# Altium schematic sheet Hdr3.SchDoc
size Letter; SheetNumber: 10; SheetTotal: 15
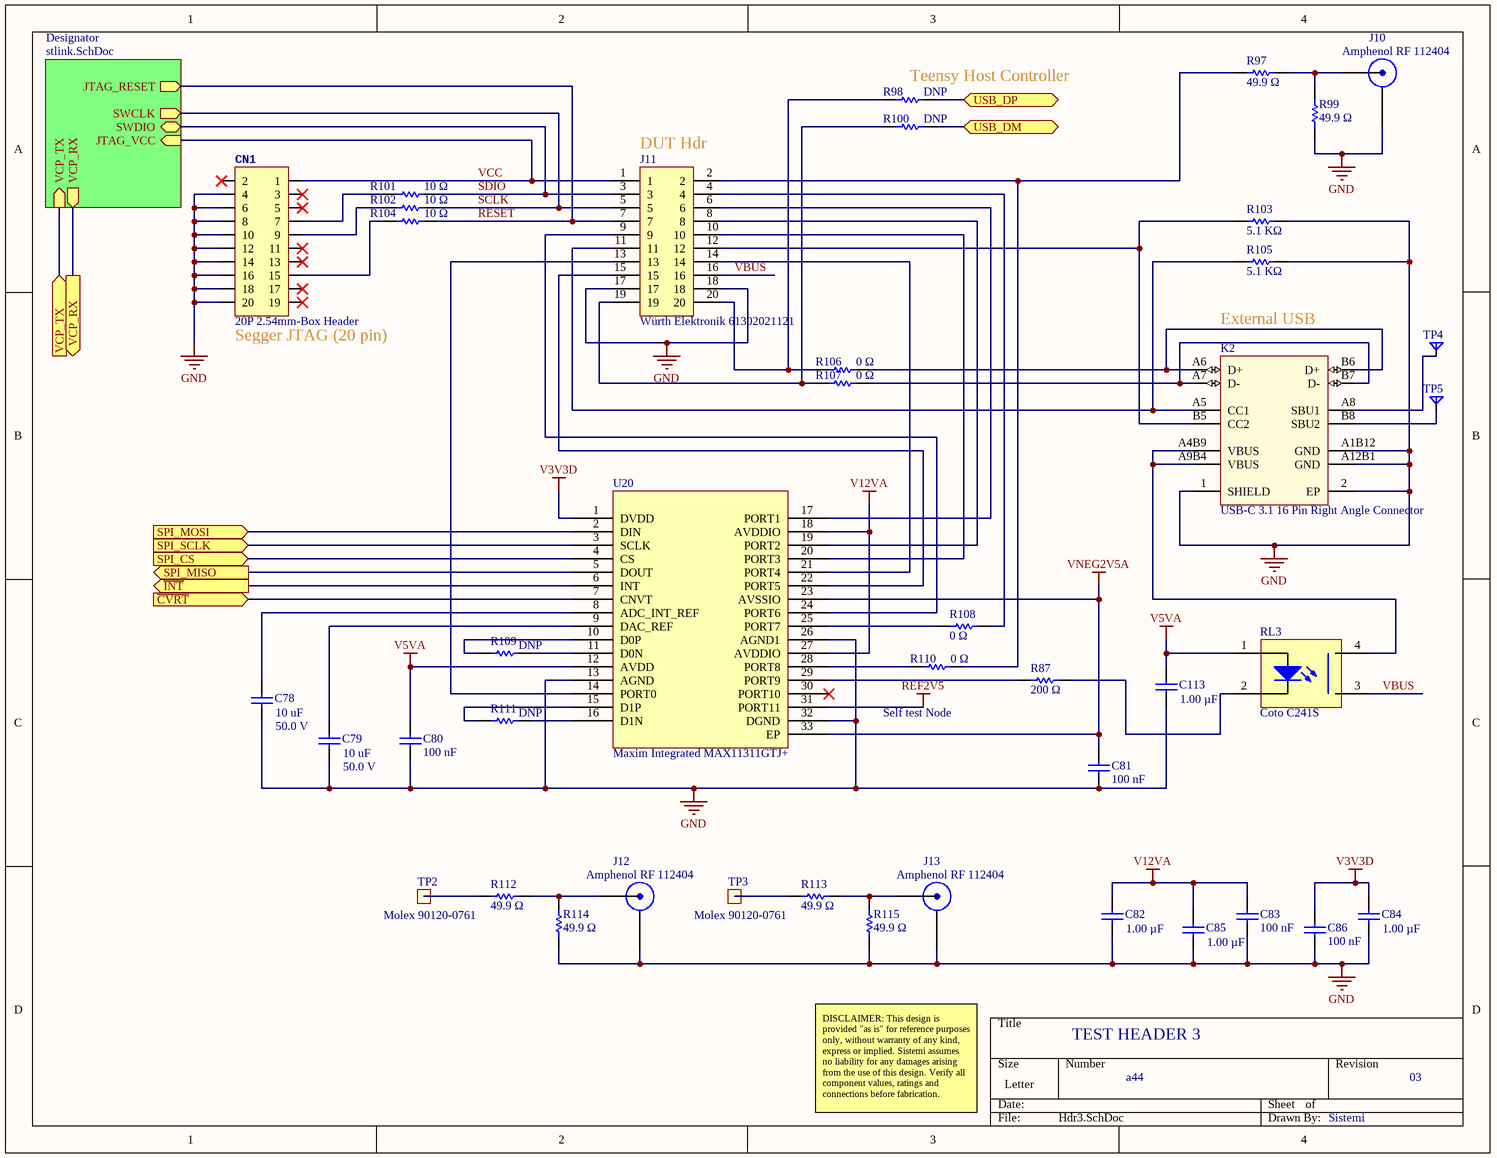
[diagram p0: Hdr3.SchDoc]

## Parts
C78  Capacitance: 10 uF  Voltage Rating (DC): 50.0 V  [CAPC3216X180X55LL20T25]  (hidden comment: Murata GRM31CR61H106KA12L)
C79  Capacitance: 10 uF  Voltage Rating (DC): 50.0 V  [CAPC3216X180X55LL20T25]  (hidden comment: Murata GRM31CR61H106KA12L)
C80  Capacitance: 100 nF  [CAPC1005X56X25NL10T15]  (hidden comment: Samsung CL05B104KO5NNNC)
C81  Capacitance: 100 nF  [CAPC1005X56X25NL10T15]  (hidden comment: Samsung CL05B104KO5NNNC)
C82  Capacitance: 1.00 µF  [CAPC1608X90X35NL15T15]  (hidden comment: Samsung CL10B105KA8NNNC)
C83  Capacitance: 100 nF  [CAPC1005X56X25NL10T15]  (hidden comment: Samsung CL05B104KO5NNNC)
C84  Capacitance: 1.00 µF  [CAPC1608X90X35NL15T15]  (hidden comment: Samsung CL10B105KA8NNNC)
C85  Capacitance: 1.00 µF  [CAPC1608X90X35NL15T15]  (hidden comment: Samsung CL10B105KA8NNNC)
C86  Capacitance: 100 nF  [CAPC1005X56X25NL10T15]  (hidden comment: Samsung CL05B104KO5NNNC)
C113  Capacitance: 1.00 µF  [CAPC1608X90X35NL15T15]  (hidden comment: Samsung CL10B105KA8NNNC)
CN1  20P 2.54mm-Box Header  [PCB-h3ow9p0wpqltbs651onh-1]
J10  Amphenol RF 112404  [PCB-bfdufqe5asedaz2dexug-1]
J11  Würth Elektronik 61302021121  [PCB-nk6cd1c3p7lqby8wsdwb-1]
J12  Amphenol RF 112404  [PCB-bfdufqe5asedaz2dexug-1]
J13  Amphenol RF 112404  [PCB-bfdufqe5asedaz2dexug-1]
K2  USB-C 3.1 16 Pin Right Angle Connector  [PCB-ld6ppm2v3fcnldhcn63r-1]
R87  Resistance: 200 Ω  [RESC1608X55X30LL15T15]  (hidden comment: Generic RES 0603)
R97  Resistance: 49.9 Ω  [RESC1608X55X30ML15T15]  (hidden comment: Generic RES 0603)
R98  Resistance: DNP  [RESC1608X55X30ML15T15]  (hidden comment: Generic RES 0603)
R99  Resistance: 49.9 Ω  [RESC1608X55X30ML15T15]  (hidden comment: Generic RES 0603)
R100  Resistance: DNP  [RESC1608X55X30ML15T15]  (hidden comment: Generic RES 0603)
R101  Resistance: 10 Ω  [RESC1005X40X25NL05T05]  (hidden comment: 10 Ω,±1%,0402)
R102  Resistance: 10 Ω  [RESC1005X40X25NL05T05]  (hidden comment: 10 Ω,±1%,0402)
R103  Resistance: 5.1 KΩ  [RESC1608X55X30ML15T15]  (hidden comment: Generic RES 0603)
R104  Resistance: 10 Ω  [RESC1005X40X25NL05T05]  (hidden comment: 10 Ω,±1%,0402)
R105  Resistance: 5.1 KΩ  [RESC1608X55X30ML15T15]  (hidden comment: Generic RES 0603)
R106  Resistance: 0 Ω  [RESC1608X55X30ML15T15]  (hidden comment: Generic RES 0603)
R107  Resistance: 0 Ω  [RESC1608X55X30ML15T15]  (hidden comment: Generic RES 0603)
R108  Resistance: 0 Ω  [RESC1608X55X30ML15T15]  (hidden comment: Generic RES 0603)
R109  Resistance: DNP  [RESC1608X55X30ML15T15]  (hidden comment: Generic RES 0603)
R110  Resistance: 0 Ω  [RESC1608X55X30ML15T15]  (hidden comment: Generic RES 0603)
R111  Resistance: DNP  [RESC1608X55X30ML15T15]  (hidden comment: Generic RES 0603)
R112  Resistance: 49.9 Ω  [RESC1608X55X30ML15T15]  (hidden comment: Generic RES 0603)
R113  Resistance: 49.9 Ω  [RESC1608X55X30ML15T15]  (hidden comment: Generic RES 0603)
R114  Resistance: 49.9 Ω  [RESC1608X55X30ML15T15]  (hidden comment: Generic RES 0603)
R115  Resistance: 49.9 Ω  [RESC1608X55X30ML15T15]  (hidden comment: Generic RES 0603)
RL3  Coto C241S  [PCB-o1m8470la7x8r6xoffbd-1]
TP2  Molex 90120-0761  [PCB-u1j2a009byds4mriae4x-1]
TP3  Molex 90120-0761  [PCB-u1j2a009byds4mriae4x-1]
TP4  Test Point Pad  [PCB-w5299rxaittb4m04ntfs-1]  (value not drawn)
TP5  Test Point Pad  [PCB-w5299rxaittb4m04ntfs-1]  (value not drawn)
U20  Maxim Integrated MAX11311GTJ+  [PCB-s1hzzxkmij8s4b201del-1]

## Sub-sheets
Designator = stlink.SchDoc: SWCLK (out), JTAG_RESET (out), SWDIO (bidir), JTAG_VCC (in), VCP_TX (in), VCP_RX (out)

## Ports
SPI_CS (in), SPI_MISO (out), SPI_MOSI (in), SPI_SCLK (in), USB_DM (bidir), USB_DP (bidir), VCP_RX (out), VCP_TX (in), ~{CVRT} (in), ~{INT} (out)

## Nets
GND: C78.1 C79.1 C80.2 C81.2 C82.1 C83.2 C84.1 C85.1 C86.2 C113.1 CN1.4 CN1.6 CN1.8 CN1.10 CN1.12 CN1.14 CN1.16 CN1.18 CN1.20 J10.2 J11.17 J11.18 J12.2 J13.2 K2.1(SHIELD) K2.2(EP) K2.A1B12(GND) K2.A12B1(GND) R99.2 R103.1 R105.1 R114.2 R115.2 U20.13(AGND) U20.26(AGND1) U20.32(DGND)
REF2V5: U20.31(PORT11)
V3V3D: C84.2 C86.1 U20.1(DVDD)
V5VA: C80.1 C113.2 RL3.1(A) U20.12(AVDD)
V12VA: C82.2 C83.1 C85.2 U20.18(AVDDIO) U20.27(AVDDIO)
VNEG2V5A: C81.1 U20.23(AVSSIO) U20.33(EP)
~{CVRT}: U20.7(CNVT) ; port ~{CVRT}
~{INT}: U20.6(INT) ; port ~{INT}
RESET: J11.7 R104.1 ; sheet Designator/JTAG_RESET
SCLK: J11.5 R102.1 ; sheet Designator/SWCLK
SDIO: J11.3 R101.1 ; sheet Designator/SWDIO
SPI_CS: U20.4(CS) ; port SPI_CS
SPI_MISO: U20.5(DOUT) ; port SPI_MISO
SPI_MOSI: U20.2(DIN) ; port SPI_MOSI
SPI_SCLK: U20.3(SCLK) ; port SPI_SCLK
USB_DM: R100.1 ; port USB_DM
USB_DP: R98.1 ; port USB_DP
VBUS: J11.16 RL3.3(S)
VCC: CN1.1 J11.1 ; sheet Designator/JTAG_VCC
VCP_RX: port VCP_RX, sheet Designator/VCP_RX
VCP_TX: port VCP_TX, sheet Designator/VCP_TX
NetC78_2: C78.2 U20.8(ADC_INT_REF)
NetC79_2: C79.2 U20.9(DAC_REF)
NetCN1_7: CN1.7 R101.2
NetCN1_9: CN1.9 R102.2
NetCN1_15: CN1.15 R104.2
NetJ10_1: J10.1 R97.2 R99.1
NetJ11_2: J11.2 R97.1 R110.1
NetJ11_4: J11.4 R108.1
NetJ11_6: J11.6 U20.17(PORT1)
NetJ11_8: J11.8 U20.19(PORT2)
NetJ11_9: J11.9 U20.24(PORT6)
NetJ11_10: J11.10 U20.20(PORT3)
NetJ11_11: J11.11 K2.A5(CC1) R105.2
NetJ11_12: J11.12 K2.B5(CC2) R103.2
NetJ11_13: J11.13 U20.14(PORT0)
NetJ11_14: J11.14 U20.21(PORT4)
NetJ11_15: J11.15 U20.22(PORT5)
NetJ11_19: J11.19 R100.2 R107.2
NetJ11_20: J11.20 R98.2 R106.2
NetJ12_1: J12.1 R112.2 R114.1
NetJ13_1: J13.1 R113.2 R115.1
NetK2_A4B9: K2.A4B9(VBUS) K2.A9B4(VBUS) RL3.4(D)
NetK2_A6: K2.A6(D+) K2.B6(D+) R106.1
NetK2_A7: K2.A7(D-) K2.B7(D-) R107.1
NetK2_A8: K2.A8(SBU1) TP4.1(A)
NetK2_B8: K2.B8(SBU2) TP5.1(A)
NetR87_1: R87.1 RL3.2(K)
NetR87_2: R87.2 U20.29(PORT9)
NetR108_2: R108.2 U20.25(PORT7)
NetR109_1: R109.1 U20.11(D0N)
NetR109_2: R109.2 U20.10(D0P)
NetR110_2: R110.2 U20.28(PORT8)
NetR111_1: R111.1 U20.16(D1N)
NetR111_2: R111.2 U20.15(D1P)
NetR112_1: R112.1 TP2.1
NetR113_1: R113.1 TP3.1

Not connected (* = marked no-connect by the designer): CN1 2* 3* 5* 11* 13* 17* 19*; U20 30(PORT10)*

## Notes on the sheet
- (near R98) Teensy Host Controller
- (near J11) DUT Hdr
- (near CN1) Segger JTAG (20 pin)
- External USB
- (near R110) Self test Node
- TEST HEADER 3
- DISCLAIMER: This design is provided "as is" for reference purposes only, without warranty of any kind, express or implied. Sistemi assumes no liability for any damages arising from the use of this design. Verify all component values, ratings and connections before fabrication.
- a44
- 03
- Sistemi

## Library data of the parts
C78 C79 = CMP-3554908-2: Multilayer Ceramic Capacitors MLCC - SMD/SMT 1206 10uF 50volt X5R +/-10%; Manufacturer Part Number: CL31B106KBHNNNE; Capacitance Tolerance: ±10%; Case/Package (SI): 3216; Lead-Free Status: Lead Free; Dielectric Characteristic: X5R; Lifecycle Status: Active; Mounting Style: Surface Mount; Number of Pins: 2; Octopart Url: https://octopart.com/grm31cr61h106ka12l-murata-18903335; OctopartID: fd8535afa9c42242; Packaging: Cut Tape (CT); REACH SVHC Compliance: No SVHC; RoHS: Compliant; Size-Length: 0.0032 m; Size-Thickness: 0.0016 m; Size-Width: 0.0016 m
C80 C81 C83 C86 = CMP-bf2276a55d9a60e5-19: Ceramic capacitor SMD-0402 100nF /16V X7R# K +-10%, Samsung, RoHS; Dielectric Characteristic: X7R; Lead-Free Status: Lead Free; Voltage Rating (DC): 16.0 V; Capacitance Tolerance: ±10%; Mounting Style: Surface Mount; Case/Package: 0402; OctopartID: 0755ced2c795d892; Footprint: PCB-0002-00476-3; Octopart URL: https://octopart.com/cl05b104ko5nnnc-samsung-9299366; RoHS: Compliant; Manufacturer Part Number: CL05B104KO5NNNC
C82 C84 C85 C113 = CMP-7473528-5: CL Series 0603 1 uF 25 V ±10 % X7R Surface Mount Multilayer Ceramic Capacitor; Manufacturer Part Number: UMK107AB7105KA-T; Lead-Free Status: Lead Free; Capacitance Tolerance: ±10%; Voltage Rating (DC): 25.0 V; RoHS: Compliant; Mounting Style: Surface Mount; Footprint: PCB-0002-00062-3; Octopart URL: http://octopart.com/cl10b105ka8nnnc-samsung-19831597; Case/Package: 0603; OctopartID: ce7a065e703111bd; Dielectric Characteristic: X7R
CN1 = CMP-2336eab41549fcf1-2: Male Box Header WR-BHD, THT, Vertical, pitch 2.54 mm, 20 pins; Manufacturer Part Number: 61202021621; Number of Contacts: 20; Dielectric Withstanding Voltage: 500 V; Current Rating: 3.00 A; Pin Pitch: 2.54 mm; Contact Resistance: 20.0 mΩ; Operating Voltage: 250 V; Insulation Resistance: 1.00 GΩ; Flammability Rating: UL 94 V-0; REACH SVHC Compliance: No SVHC; Color: Black; RoHS: Compliant; Mounting Style: Through Hole; Number of Pins: 20; Contact Plating: Gold; Packaging: Tray; OctopartID: 2336eab41549fcf1; Orientation: Vertical; Contact Material: Copper; Operating Temperature: -40.0 °C (min); Octopart URL: https://octopart.com/61202021621-w%C3%BCrth+elektronik-8917785; Gender: Male
J10 J12 J13 = CMP-eda0265619973267-4: connector, rf coaxial, bnc str pcb mt recept jack, 4 legs, length .717 inch, 50 ohm; Manufacturer Part Number: 112404; Lead-Free Status: Lead Free; Gender: Male; Frequency: 4.00 GHz (max); Dielectric Material: Teflon; OctopartID: eda0265619973267; ComponentLink1URL: https://grabcad.com/library/amphenol-rf-4-ghz-bnc-coaxial-bulkhead-vertical-pcb-connector-1; Contact Material: Phosphor Bronze; Mounting Style: Through Hole; Contact Plating: Gold; Octopart URL: https://octopart.com/112404-amphenol+rf-50123089; ComponentLink1Description: STEP model; RoHS: Compliant
J11 = CMP-005cc8a3733edf9b-7: THT Vertical Pin Header WR-PHD, Pitch 2.54 mm, Dual Row, 20 pins; Current Rating: 3.00 A; Dielectric Withstanding Voltage: 500 V; Pin Pitch: 2.54 mm; Operating Voltage: 250 V; Number of Contacts: 20; Contact Resistance: 20.0 mΩ; Gender: Male; Contact Material: Copper; Footprint: PCB-005cc8a3733edf9b-1; Mounting Style: Through Hole; Color: Black; Contact Plating: Gold; REACH SVHC Compliance: No SVHC; RoHS: Compliant; Octopart URL: https://octopart.com/61302021121-w%C3%BCrth+elektronik-32855556; Packaging: Bag; Orientation: Vertical; OctopartID: 005cc8a3733edf9b; Number of Pins: 20; Operating Temperature: -40.0 °C (min); Manufacturer Part Number: 61302021121
K2 = CMP-qyb7yekqcd84h33ugas0-5: Manufacturer Part Number: USB4105-GF-A-120; CustomComponentID: qyb7yekqcd84h33ugas0
R87 = CMP-0800c38b3cf2d7c7-3: Generic RES 0603, =Resistance+','+Tolerance+','+Case; Manufacturer Part Number: RT0603FRE10200RL; Case/Package (SI): 1608; Lead-Free Status: Lead Free; Power Rating: 63.0 mW; Voltage: 50V; ELV Compliant: Compliant; Tolerance: ±1%; Temperature Coefficient: -50.0 ppm/°C to 50.0 ppm/°C; Octopart URL: TBD; Number of Pins: 2; Mounting Style: Surface Mount; Packaging: Tape & Reel (TR); Lifecycle Status: Active; RoHS: Compliant; Case: 0603; Operating Temperature: -55.0 °C to 125 °C; REACH SVHC Compliance: No SVHC; Footprint: PCB-0002-00066-3; OctopartID: a8e96364fc37772e
R97 R99 R112-R115 = CMP-0800c38b3cf2d7c7-3: Generic RES 0603, =Resistance+','+Tolerance+','+Case; Manufacturer Part Number: AC1206FR-0749R9L; Case/Package (SI): 1608; Lead-Free Status: Lead Free; Power Rating: 63.0 mW; Voltage: 50V; ELV Compliant: Compliant; Tolerance: ±1%; Temperature Coefficient: -50.0 ppm/°C to 50.0 ppm/°C; Octopart URL: TBD; Number of Pins: 2; Mounting Style: Surface Mount; Packaging: Tape & Reel (TR); Lifecycle Status: Active; RoHS: Compliant; Case: 0603; Operating Temperature: -55.0 °C to 125 °C; REACH SVHC Compliance: No SVHC; Footprint: PCB-0002-00066-3; OctopartID: a8e96364fc37772e
R98 R100 R109 R111 = CMP-0800c38b3cf2d7c7-3: Generic RES 0603, =Resistance+','+Tolerance+','+Case; Manufacturer Part Number: TBD; Case/Package (SI): 1608; Lead-Free Status: Lead Free; Power Rating: 63.0 mW; Voltage: 50V; ELV Compliant: Compliant; Tolerance: ±1%; Temperature Coefficient: -50.0 ppm/°C to 50.0 ppm/°C; Octopart URL: TBD; Number of Pins: 2; Mounting Style: Surface Mount; Packaging: Tape & Reel (TR); Lifecycle Status: Active; RoHS: Compliant; Case: 0603; Operating Temperature: -55.0 °C to 125 °C; REACH SVHC Compliance: No SVHC; Footprint: PCB-0002-00066-3; OctopartID: a8e96364fc37772e
R101 R102 R104 = CMP-3902036-3: Generic RES 0402, =Resistance+','+Tolerance+','+Case; Manufacturer Part Number: RT0402FRE0710RL; Lead-Free Status: Lead Free; Voltage: 50.0 V; Power: 0.063 W; Mounting Style: Surface Mount; RoHS: Compliant; Number of Pins: 2; Tolerance: ±1%; Octopart Url: TBD; Case: 0402; OctopartID: 26dced8948c2f91b
R103 R105 = CMP-0800c38b3cf2d7c7-3: Generic RES 0603, =Resistance+','+Tolerance+','+Case; Manufacturer Part Number: RT0603FRE075K1L; Case/Package (SI): 1608; Lead-Free Status: Lead Free; Power Rating: 63.0 mW; Voltage: 50V; ELV Compliant: Compliant; Tolerance: ±1%; Temperature Coefficient: -50.0 ppm/°C to 50.0 ppm/°C; Octopart URL: TBD; Number of Pins: 2; Mounting Style: Surface Mount; Packaging: Tape & Reel (TR); Lifecycle Status: Active; RoHS: Compliant; Case: 0603; Operating Temperature: -55.0 °C to 125 °C; REACH SVHC Compliance: No SVHC; Footprint: PCB-0002-00066-3; OctopartID: a8e96364fc37772e
R106-R108 R110 = CMP-0800c38b3cf2d7c7-3: Generic RES 0603, =Resistance+','+Tolerance+','+Case; Manufacturer Part Number: CRCW06030000Z0EAC; Case/Package (SI): 1608; Lead-Free Status: Lead Free; Power Rating: 63.0 mW; Voltage: 50V; ELV Compliant: Compliant; Tolerance: ±1%; Temperature Coefficient: -50.0 ppm/°C to 50.0 ppm/°C; Octopart URL: TBD; Number of Pins: 2; Mounting Style: Surface Mount; Packaging: Tape & Reel (TR); Lifecycle Status: Active; RoHS: Compliant; Case: 0603; Operating Temperature: -55.0 °C to 125 °C; REACH SVHC Compliance: No SVHC; Footprint: PCB-0002-00066-3; OctopartID: a8e96364fc37772e
RL3 = CMP-147564696-2: Coto Mosfet - 1 Form A, 5A, 20V Max/ Tape-Reel; OctopartID: 147564696; Manufacturer Part Number: C241S; Octopart Url: https://octopart.com/c241s-coto-147564696
TP2 TP3 = CMP-b48f7df16db76b48-3: 2.54mm (.100") Pitch C-Grid III Header, Single Row, Vertical, 40 Circuits, Gold (Au) Plating; Gender: Male; Current Rating: 3.00 A; Number of Contacts: 1; Glow Wire Compliant: Non-Compliant; Number of Circuits: 40; Halogen Free Status: Not Reviewed; Manufacturer Part Number: 90120-0761; Lifecycle Status: Not Listed by Manufacturer; Contact Material: Brass; OctopartID: b48f7df16db76b48; Orientation: Vertical; RoHS: Compliant; Mounting Style: Through Hole, Vertical; Number of Rows: 1; Contact Plating: Gold; Octopart URL: http://octopart.com/90120-0761-molex-7666782
TP4 TP5 = CMP-lokszv1vctu4w47553pe-6: Test Point
U20 = CMP-2cd8e1e00624f31f-4: 12-channel 12-Bit ADC and 12-Bit DAC, Analog PIXI, 12-Port Programmable Mixed-Signal I/O; Channels: 12; Lead-Free Status: Lead Free; Sample Rate: 400 kHz; Range Options: 0 to 2.5V, ±5V, 0 to +10V, -10V; Supply Voltage (DC): 4.75 V (max), 5.25 V (min); Manufacturer Part Number: MAX11311GTJ+; Lifecycle Status: Not Listed by Manufacturer; Octopart URL: http://octopart.com/max11311gtj%2B-maxim+integrated-70389658; RoHS: Compliant; Number of Bits: 12; OctopartID: 2cd8e1e00624f31f; Package: TQFN-32; Resolution: 12-bit